# Altium schematic sheet EMGfrontend.SchDoc
size A; SheetNumber: 1; SheetTotal: 6
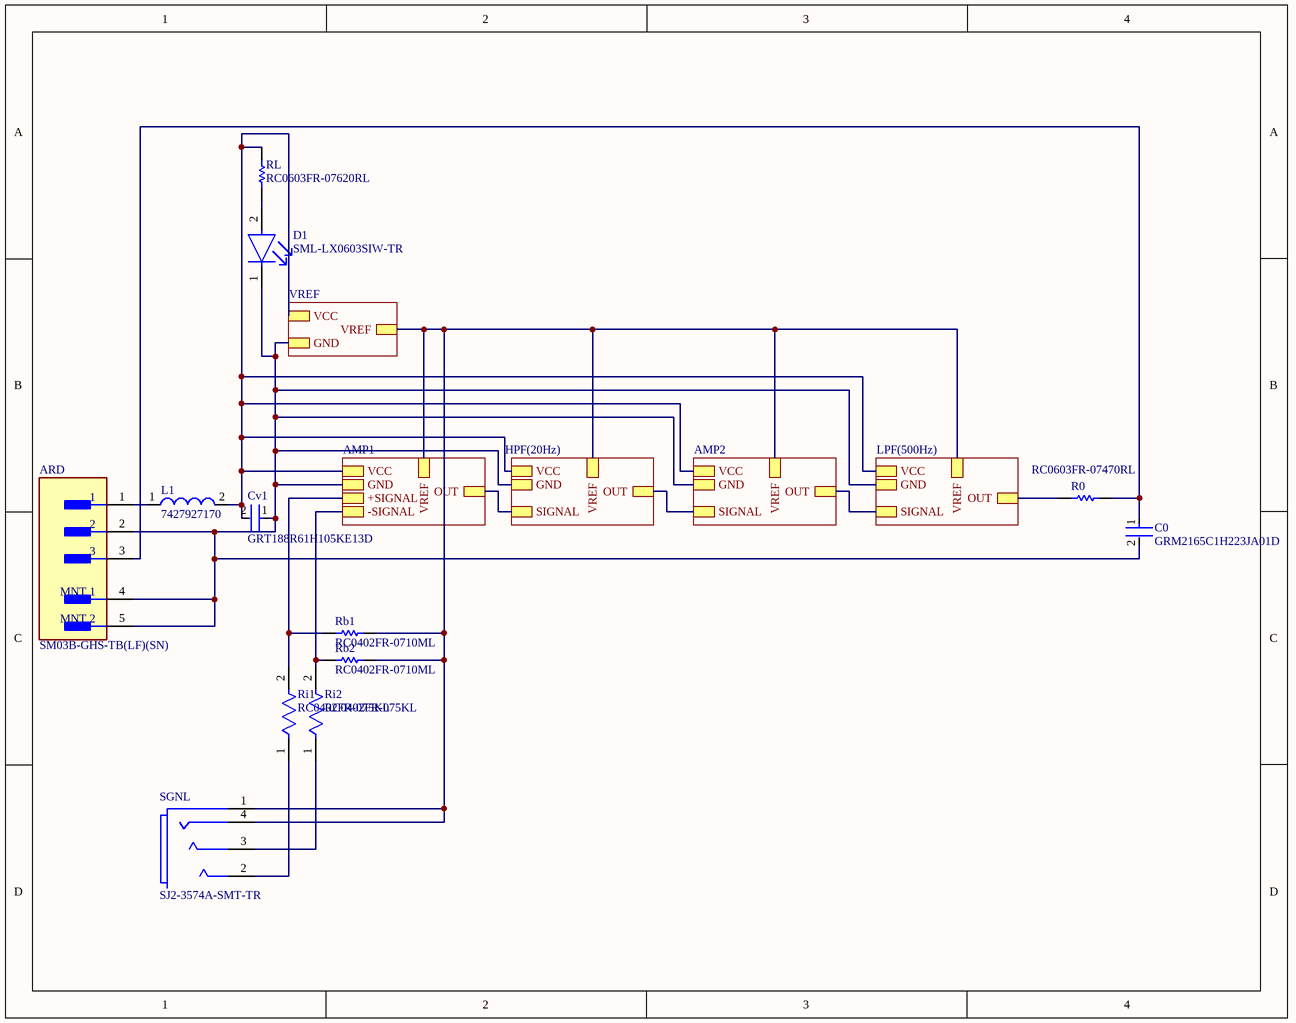
[diagram p0: EMGfrontend.SchDoc]

## Parts
ARD  SM03B-GHS-TB(LF)(SN)  [FP-SM03B-GHS-TB_LF_SN-MFG]
C0  GRM2165C1H223JA01D  [FP-GRM216-0_1-0_05-D]
Cv1  GRT188R61H105KE13D  [FP-GRT188-0_1-e0_2_0_5-IPC_B]
D1  SML-LX0603SIW-TR  [FP-SML-LX0603SIW-TR-MFG]
L1  7427927170  [SMD-0402]
R0  RC0603FR-07470RL  [RESC1608X55X25LL10T15]
Rb1  RC0402FR-0710ML  [RESC1005X40X25MML05T10]
Rb2  RC0402FR-0710ML  [RESC1005X40X25MML05T10]
Ri1  RC0402FR-075KL  [FP-RC0402-MFG-TINY]
Ri2  RC0402FR-075KL  [FP-RC0402-MFG-TINY]
RL  RC0603FR-07620RL  [RESC1608X55X25ML10T15]
SGNL  SJ2-3574A-SMT-TR  [FP-SJ2-3574A-SMT-TR-MFG]

## Sub-sheets
AMP1 = AMP1.SchDoc: VREF, +SIGNAL, OUT, GND, VCC, -SIGNAL
AMP2 = AMP2.SchDoc: VREF, SIGNAL, VCC, GND, OUT
HPF(20Hz) = HPF(20Hz).SchDoc: SIGNAL, VREF, OUT, VCC, GND
LPF(500Hz) = LPF(500Hz).SchDoc: SIGNAL, VCC, GND, VREF, OUT
VREF = VREF.SchDoc: VREF, VCC, GND

## Nets
NetARD_1: ARD.1 L1.1
NetARD_2: ARD.2 ARD.4(MNT_1) ARD.5(MNT_2) C0.2 Cv1.1 D1.1(C) ; sheet VREF/GND, sheet AMP2/GND, sheet LPF(500Hz)/GND, sheet AMP1/GND, sheet HPF(20Hz)/GND
NetARD_3: ARD.3 C0.1 R0.2
NetCv1_2: Cv1.2 L1.2 RL.2 ; sheet VREF/VCC, sheet AMP2/VCC, sheet LPF(500Hz)/VCC, sheet AMP1/VCC, sheet HPF(20Hz)/VCC
NetD1_2: D1.2(A) RL.1
NetR0_1: R0.1 ; sheet LPF(500Hz)/OUT
NetRb1_1: Rb1.1 Ri1.2 ; sheet AMP1/+SIGNAL
NetRb1_2: Rb1.2 Rb2.2 SGNL.1(sleeve) SGNL.4(ring_2) ; sheet VREF/VREF, sheet AMP2/VREF, sheet LPF(500Hz)/VREF, sheet AMP1/VREF, sheet HPF(20Hz)/VREF
NetRb2_1: Rb2.1 Ri2.2 ; sheet AMP1/-SIGNAL
NetRi1_1: Ri1.1 SGNL.2(tip)
NetRi2_1: Ri2.1 SGNL.3(ring_1)
(unnamed): sheet AMP2/SIGNAL, sheet HPF(20Hz)/OUT
(unnamed): sheet AMP2/OUT, sheet LPF(500Hz)/SIGNAL
(unnamed): sheet AMP1/OUT, sheet HPF(20Hz)/SIGNAL

## Library data of the parts
ARD = CMP-17439-000068-1: CONN HEADER SMD R/A 3POS 1.25MM; Voltage Rating: 50V; Wire/Cable Gauge: 26AWG; Pitch: 0.049inch; Gender: Male; Number of Positions: 3; Current Rating: 1A; Orientation: Right Angle; REACH SVHC: No SVHC; Insulation Color: Natural; Housing Material: Nylon; Mount: Surface Mount; Flammability Rating: UL94 V-0; Color: Natural; Number of Rows: 1; Housing Color: Natural; Termination: Solder; Voltage Rating (AC): 50V; Max Operating Temperature: 85°C; Connector Type: Header; Series: GH; Packaging: Tape and Reel; Contact Finish - Mating: TIN; Lead Free: Lead Free; Fastening Type: Ramp; Contact Plating: Tin; Contact Material: Bronze; Insulation Material: Nylon; Contact Type: Outer Shroud Contact; Number of Contacts: 3; Min Operating Temperature: -25°C; Contact Shape: Rectangular
C0 = CMP-06035-050815-1: Chip Multilayer Ceramic Capacitors for General Purpose, 0805, 22000pF, C0G, 30ppm/°C, 5%, 50V
Cv1 = CMP-06035-031856-1: Multi-Layer Ceramic Capacitor 1uF 50V X5R ±10% 0603 Paper T/R; Voltage Rating (DC): 50V; Voltage Rating: 50V; Min Operating Temperature: -55°C; Case Code (Metric): 1608; Thickness: 0.035inch; Width: 0.031inch; Capacitance: 1uF; Tolerance: 10%; Max Operating Temperature: 85°C; Dielectric: X5R; Case Code (Imperial): 0603; Case/Package: 0603; Length: 0.063inch; Packaging: Tape and Reel; Mount: Surface Mount; Ratings: AEC-Q200
D1 = CMP-57192-000009-1: LED RED DIFFUSED SMD; Test Current: 20mA; Forward Voltage: 2V; Approvals: UL; Dominant Wavelength: 636nm; Viewing Angle: 140°; Lens Color: White; Luminous Intensity: 60mcd; Power Rating: 50mW; Number of LEDs: 1; Color: Red; Forward Current: 20mA; Moisture Sensitivity Level: 2; Case Code (Imperial): 0603; Lead Free: Lead Free; Lens Transparency: Diffused; Case Code (Metric): 1608; Height: 0.6mm; Max Operating Temperature: 85°C; Width: 0.8mm; Lens Style: Diffused; Illumination Color: Red; Wavelength: 636nm; REACH SVHC: No SVHC; Package Quantity: 1; RoHS Compliant: Yes; Case/Package: 0603; Number of Pins: 2; Packaging: Tape and Reel; Length: 1.6mm; Mount: Surface Mount; Min Operating Temperature: -25°C
L1 = CMP-0220-00142-1: SMD EMI Suppression Ferrite Bead WE-CBF, Z = 75 Ohm; Impedance: 75 Ohm; ComponentLink2Description: Datasheet; ComponentLink2URL: http://www.we-online.de/katalog/media/pdf/7427927170.pdf; ComponentLink1URL: http://www.we-online.com; PackageVersion: 2009; ComponentLink1Description: Manufacturer Link; PackageReference: SMD-0402; PackageDescription: Chip Inductor, 2-Leads, Body 1.0 x 0.5 mm; DatasheetVersion: ver 1, Jul-2009
R0 = CMP-1659-00035-2: General Purpose Chip Resistor, 470 Ohm, +/- 1%, -55 to 155 degC, 0603 (1608 Metric), RoHS, Tape and Reel; Resistance: 470 Ohm; ComponentLink1Description: Manufacturer URL; Contact Plating: Gold; Width: 3.1 mm; Radiation Hardening: No; DatasheetVersion: Rev. 4, 04/2009; Length: 3 mm; PackageDescription: 2-Pin Surface Mount Device, Body 1.6 x 0.8 mm; ComponentLink1URL: http://www.yageo.com/; Min Operating Temperature: -40 degC; Mount: Surface Mount; Package Quantity: 2500; ComponentLink2URL: https://datasheet.ciiva.com/11808/0900766b80f96399-11808177.pdf; RoHSCompliant: true; Fastening Type: Snap; PackageReference: 0603; Max Operating Temperature: 90 degC; Height: 1.25 mm; Packaging: Tape and Reel; ComponentLink2Description: Datasheet; Contact Material: Brass
Rb1 Rb2 = CMP-2002-07354-1: Manufacturer: Yageo / Phycomp; Part Number: RC0402FR-0710ML
Ri1 Ri2 = CMP-03412-013078-1: RES SMD 5K OHM 1% 1/16W 0402; Manufacturer: Yageo; Resistance: 5kΩ; Temperature Coefficient: 100ppm/°C; Power Rating: 0.0625W; Voltage Rating: 50V; Value: 5kΩ; Temperature Range Low: -55°C; Lead Free: Yes; RoHS: TRUE; Device Class L2: Resistors; Package: RC0402; Footprint Url: https://pccomponents.com/datasheets/YAGEO-20RESISTORS.PDF; Height: 0.4mm; ComponentLink2URL: http://www.yageo.com/documents/recent/PYu-RC_Group_51_RoHS_L_10.pdf; Temperature: -55°C to +155°C; Composition: Thick Film; Device Class L1: Passive Components; Series: RC_L; Ipc Land Pattern Name: RESC10050X35; Tolerance: 1%; Device Class L3: Chip SMD Resistors; Temperature Range High: +155°C; Category: Res; Automotive: No; Octopart: https://octopart.com/rc0402fr-075kl-yageo-25450038; Digikey Description: RES SMD 5K OHM 1% 1/16W 0402; ComponentLink2Description: Datasheet; Manufacturer Part Number: RC0402FR-075KL
RL = CMP-2000-04103-1: Manufacturer: Yageo; Part Number: RC0603FR-07620RL
SGNL = CMP-14818-000001-1: AUDIO JACK, 3.5 MM, RT, 4 CONDUC; Manufacturer: CUI; Conn Orientation: Horizontal; Current Rating: 1A; Number Of Contacts: 4; Voltage Rating: 12V; Package: SJ2-3574A-SMT-TR; Device Class L1: Connectors; Lead Free: Yes; Digikey Description: AUDIO JACK, 3.5 MM, RT, 4 CONDUC; Device Class L2: Audio / Video Connectors; ComponentLink2URL: https://www.cui.com/product/resource/sj2-357x-smt.pdf; Automotive: No; RoHS: TRUE; Height: 5.3mm; Temperature Range Low: -25°C; Category: Conn; Temperature: -25°C to +85°C; Octopart: https://octopart.com/sj2-3574a-smt-tr-cui-77838840; Device Class L3: unset; Contact Material: Silver; Manufacturer Part Number: SJ2-3574A-SMT-TR; Temperature Range High: +85°C; ComponentLink2Description: Datasheet